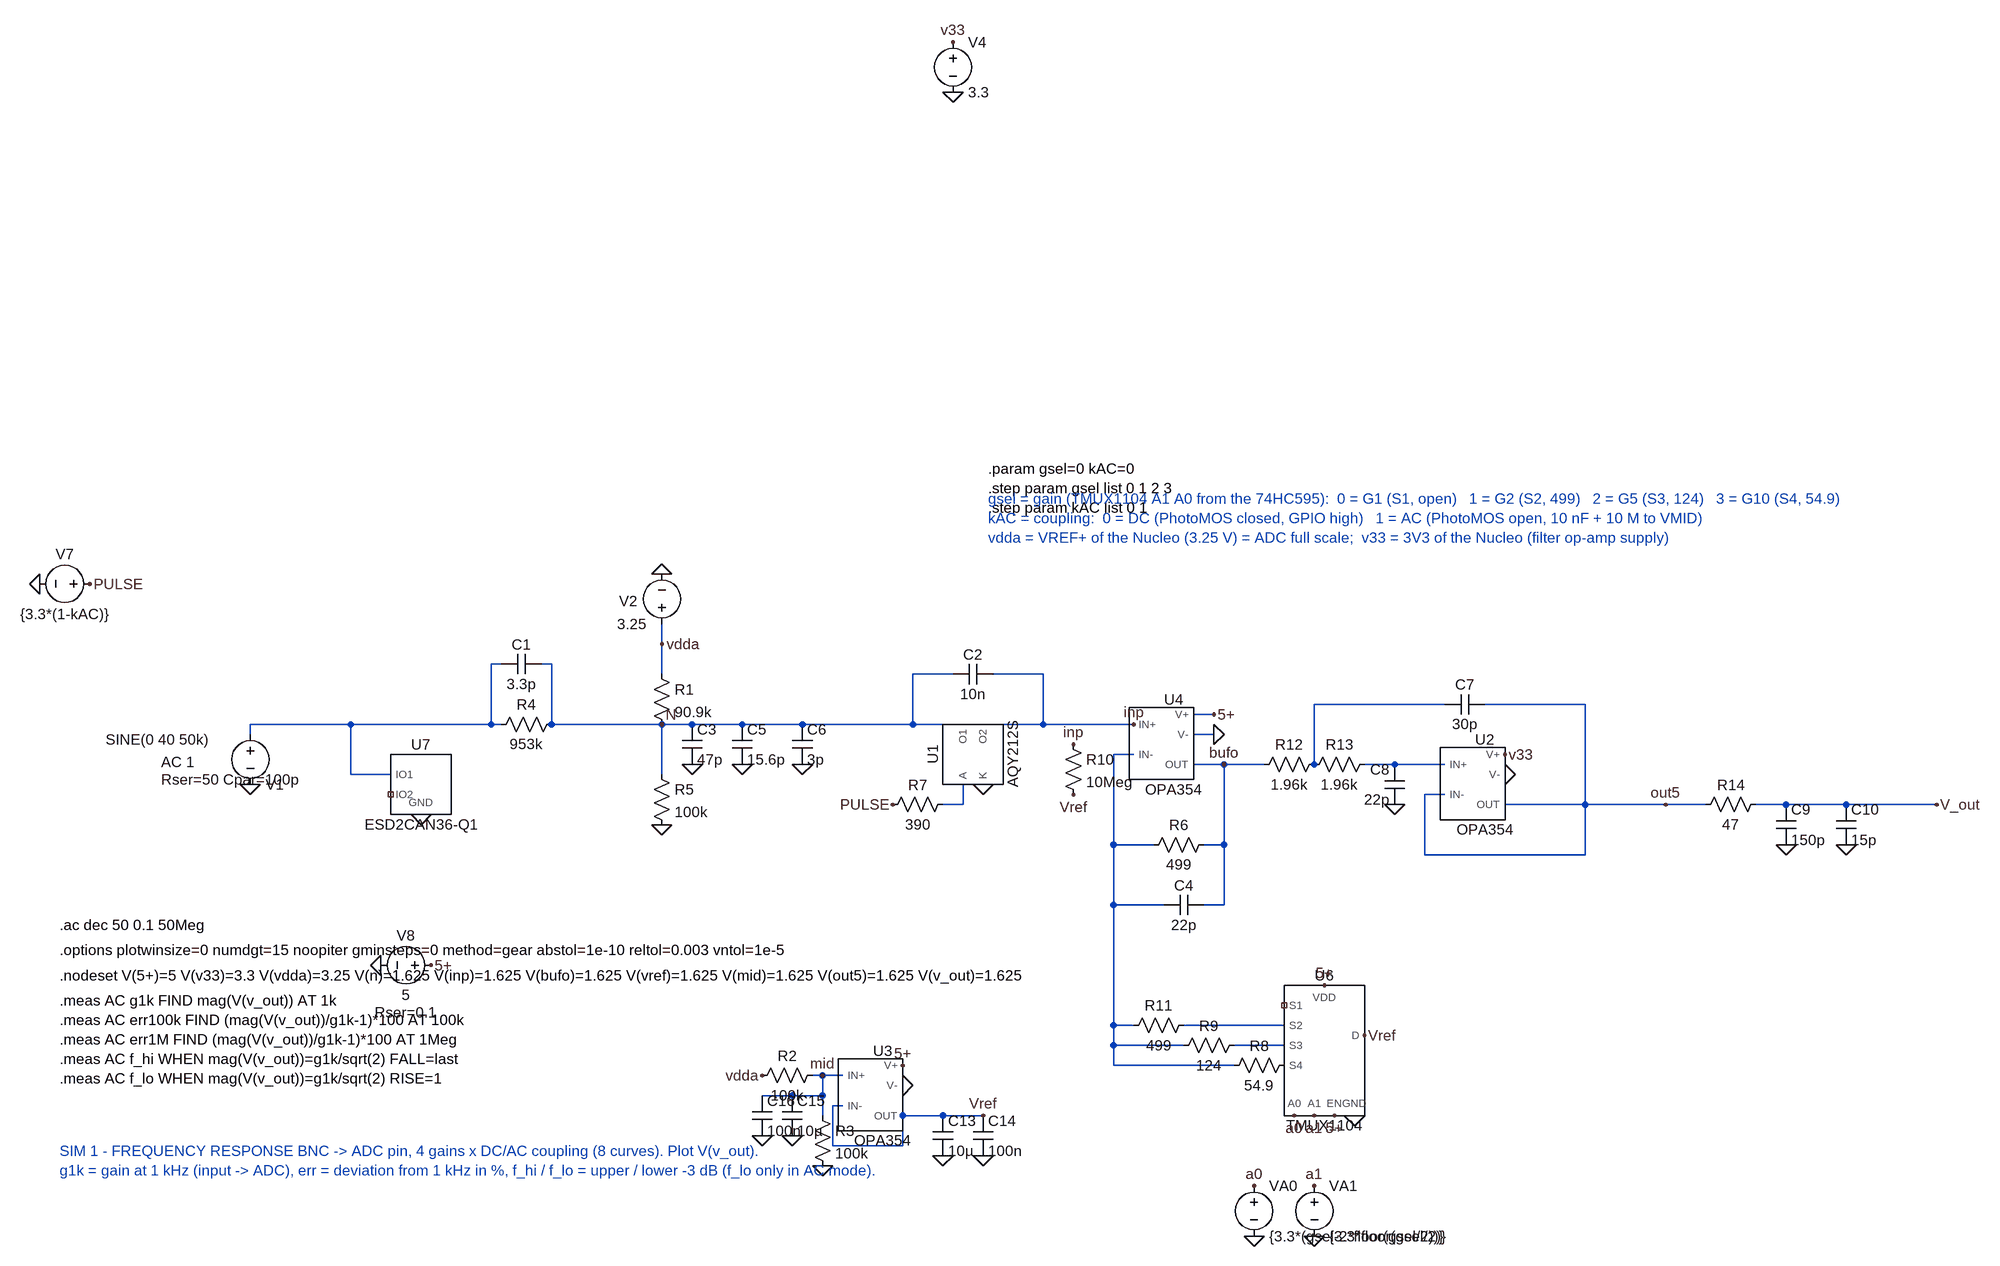
[diagram p0: schematic Analog Front End_v2_1_AC.asc]
Analog Front End_v2_1_AC.asc, the LTspice schematic file:
Version 4
SHEET 1 2772 884
WIRE 656 32 656 0
WIRE 400 64 384 64
WIRE 480 64 464 64
WIRE 656 80 656 32
WIRE 1120 80 1056 80
WIRE 1264 80 1184 80
WIRE 1904 128 1696 128
WIRE 2128 128 1968 128
WIRE 1536 144 1504 144
WIRE 160 160 0 160
WIRE 384 160 384 64
WIRE 384 160 160 160
WIRE 400 160 384 160
WIRE 480 160 480 64
WIRE 656 160 480 160
WIRE 704 160 656 160
WIRE 784 160 704 160
WIRE 880 160 784 160
WIRE 1056 160 1056 80
WIRE 1056 160 880 160
WIRE 1136 160 1056 160
WIRE 1264 160 1264 80
WIRE 1264 160 1168 160
WIRE 1408 160 1264 160
WIRE 0 176 0 160
WIRE 1536 176 1504 176
WIRE 1408 208 1376 208
WIRE 1552 224 1504 224
WIRE 1616 224 1552 224
WIRE 1696 224 1696 128
WIRE 1824 224 1776 224
WIRE 1904 224 1824 224
WIRE 160 240 160 160
WIRE 224 240 160 240
WIRE 656 240 656 160
WIRE 1904 272 1872 272
WIRE 1136 288 1136 256
WIRE 1136 288 1104 288
WIRE 2128 288 2128 128
WIRE 2128 288 2000 288
WIRE 2256 288 2128 288
WIRE 2320 288 2256 288
WIRE 2448 288 2400 288
WIRE 2544 288 2448 288
WIRE 2688 288 2544 288
WIRE 1376 352 1376 208
WIRE 1440 352 1376 352
WIRE 1552 352 1552 224
WIRE 1552 352 1520 352
WIRE 1872 368 1872 272
WIRE 2128 368 2128 288
WIRE 2128 368 1872 368
WIRE 1376 448 1376 352
WIRE 1456 448 1376 448
WIRE 1552 448 1552 352
WIRE 1552 448 1520 448
WIRE 1376 640 1376 448
WIRE 1408 640 1376 640
WIRE 1648 640 1488 640
WIRE 1376 672 1376 640
WIRE 1488 672 1376 672
WIRE 1648 672 1568 672
WIRE 1376 704 1376 672
WIRE 1568 704 1376 704
WIRE 912 720 896 720
WIRE 944 720 912 720
WIRE 864 752 816 752
WIRE 912 752 912 720
WIRE 912 752 864 752
WIRE 944 768 928 768
WIRE 912 784 912 752
WIRE 1104 784 1040 784
WIRE 1168 784 1104 784
WIRE 928 832 928 768
WIRE 1040 832 1040 784
WIRE 1040 832 928 832
FLAG 656 -80 0
FLAG 912 864 0
FLAG 656 320 0
FLAG 0 256 0
FLAG 1120 -928 v33
FLAG 1120 -848 0
FLAG 704 224 0
FLAG -256 -64 PULSE
FLAG -336 -64 0
FLAG 288 544 5+
FLAG 208 544 0
FLAG 784 224 0
FLAG 1536 144 5+
FLAG 1536 176 0
FLAG 880 224 0
FLAG 656 160 N
FLAG 1552 224 bufo
FLAG 912 720 mid
FLAG 656 32 vdda
FLAG 816 720 vdda
FLAG 1040 704 5+
FLAG 1040 736 0
FLAG 1168 784 Vref
FLAG 864 816 0
FLAG 816 816 0
FLAG 1104 848 0
FLAG 1168 848 0
FLAG 272 304 0
FLAG 1024 288 PULSE
FLAG 1168 256 0
FLAG 1776 656 Vref
FLAG 1760 784 0
FLAG 1824 288 0
FLAG 2000 208 v33
FLAG 2000 240 0
FLAG 2688 288 V_out
FLAG 2448 352 0
FLAG 2256 288 out5
FLAG 2544 352 0
FLAG 1712 576 5+
FLAG 1728 784 5+
FLAG 1664 784 a0
FLAG 1696 784 a1
FLAG 1600 896 a0
FLAG 1600 976 0
FLAG 1696 896 a1
FLAG 1696 976 0
FLAG 1408 160 inp
FLAG 1312 192 inp
FLAG 1312 272 Vref
SYMBOL voltage 656 16 R180
WINDOW 0 39 53 Left 2
WINDOW 3 24 16 Left 2
WINDOW 123 0 0 Left 0
WINDOW 39 0 0 Left 0
SYMATTR InstName V2
SYMATTR Value 3.25
SYMBOL res 640 64 R0
SYMATTR InstName R1
SYMATTR Value 90.9k
SYMBOL res 912 704 R90
WINDOW 0 0 56 VBottom 2
WINDOW 3 32 56 VTop 2
SYMATTR InstName R2
SYMATTR Value 100k
SYMBOL res 896 768 R0
SYMATTR InstName R3
SYMATTR Value 100k
SYMBOL res 640 224 R0
SYMATTR InstName R5
SYMATTR Value 100k
SYMBOL voltage 1120 -944 R0
WINDOW 123 0 0 Left 0
WINDOW 39 0 0 Left 0
SYMATTR InstName V4
SYMATTR Value 3.3
SYMBOL voltage 0 160 R0
WINDOW 0 24 96 Left 2
WINDOW 3 -231 24 Left 2
WINDOW 123 -142 60 Left 2
WINDOW 39 -142 88 Left 2
SYMATTR InstName V1
SYMATTR Value SINE(0 40 50k)
SYMATTR Value2 AC 1
SYMATTR SpiceLine Rser=50 Cpar=100p
SYMBOL cap 688 160 R0
SYMATTR InstName C3
SYMATTR Value 47p
SYMATTR SpiceLine Rser=0.3 Lser=0.7n
SYMBOL voltage -240 -64 R90
WINDOW 0 -32 56 VBottom 2
WINDOW 3 32 56 VTop 2
WINDOW 123 0 0 Left 0
WINDOW 39 0 0 Left 0
SYMATTR InstName V7
SYMATTR Value {3.3*(1-kAC)}
SYMBOL voltage 304 544 R90
WINDOW 0 -32 56 VBottom 2
WINDOW 3 32 56 VTop 2
WINDOW 123 0 0 Left 0
WINDOW 39 60 56 VTop 2
SYMATTR InstName V8
SYMATTR Value 5
SYMATTR SpiceLine Rser=0.1
SYMBOL OPA354 1472 192 R0
SYMATTR InstName U4
SYMBOL cap 768 160 R0
SYMATTR InstName C5
SYMATTR Value 15.6p
SYMATTR SpiceLine Rser=1 Lser=1n
SYMBOL cap 864 160 R0
SYMATTR InstName C6
SYMATTR Value 3p
SYMBOL OPA354 1008 752 R0
SYMATTR InstName U3
SYMBOL cap 848 752 R0
SYMATTR InstName C15
SYMATTR Value 10µ
SYMATTR SpiceLine Rser=0.02 Lser=1.5n
SYMBOL cap 800 752 R0
SYMATTR InstName C16
SYMATTR Value 100n
SYMATTR SpiceLine Rser=0.05 Lser=0.7n
SYMBOL cap 1088 784 R0
SYMATTR InstName C13
SYMATTR Value 10µ
SYMATTR SpiceLine Rser=1.02 Lser=1.5n
SYMBOL cap 1152 784 R0
SYMATTR InstName C14
SYMATTR Value 100n
SYMATTR SpiceLine Rser=0.05 Lser=0.7n
SYMBOL TMUX1104 1712 672 R0
SYMATTR InstName U6
SYMBOL ESD2CAN36-Q1 272 256 R0
SYMATTR InstName U7
SYMBOL res 496 144 R90
WINDOW 0 0 56 VBottom 2
WINDOW 3 32 56 VTop 2
SYMATTR InstName R4
SYMATTR Value 953k
SYMBOL cap 464 48 R90
WINDOW 0 0 32 VBottom 2
WINDOW 3 32 32 VTop 2
SYMATTR InstName C1
SYMATTR Value 3.3p
SYMATTR SpiceLine Rser=1 Lser=1n
SYMBOL cap 1184 64 R90
WINDOW 0 0 32 VBottom 2
WINDOW 3 32 32 VTop 2
SYMATTR InstName C2
SYMATTR Value 10n
SYMATTR SpiceLine Rser=1 Lser=1n
SYMBOL AQY212S 1152 208 R270
SYMATTR InstName U1
SYMBOL res 1120 272 R90
WINDOW 0 0 56 VBottom 2
WINDOW 3 32 56 VTop 2
SYMATTR InstName R7
SYMATTR Value 390
SYMBOL res 1536 336 R90
WINDOW 0 0 56 VBottom 2
WINDOW 3 32 56 VTop 2
SYMATTR InstName R6
SYMATTR Value 499
SYMBOL cap 1520 432 R90
WINDOW 0 0 32 VBottom 2
WINDOW 3 32 32 VTop 2
SYMATTR InstName C4
SYMATTR Value 22p
SYMATTR SpiceLine Rser=0.3 Lser=0.7n
SYMBOL res 1664 688 R90
WINDOW 0 0 56 VBottom 2
WINDOW 3 32 56 VTop 2
SYMATTR InstName R8
SYMATTR Value 54.9
SYMBOL res 1584 656 R90
WINDOW 0 0 56 VBottom 2
WINDOW 3 32 56 VTop 2
SYMATTR InstName R9
SYMATTR Value 124
SYMBOL res 1504 624 R90
WINDOW 0 0 56 VBottom 2
WINDOW 3 32 56 VTop 2
SYMATTR InstName R11
SYMATTR Value 499
SYMBOL OPA354 1968 256 R0
SYMATTR InstName U2
SYMBOL res 1712 208 R90
WINDOW 0 0 56 VBottom 2
WINDOW 3 32 56 VTop 2
SYMATTR InstName R12
SYMATTR Value 1.96k
SYMBOL res 1792 208 R90
WINDOW 0 0 56 VBottom 2
WINDOW 3 32 56 VTop 2
SYMATTR InstName R13
SYMATTR Value 1.96k
SYMBOL cap 1968 112 R90
WINDOW 0 0 32 VBottom 2
WINDOW 3 32 32 VTop 2
SYMATTR InstName C7
SYMATTR Value 30p
SYMATTR SpiceLine Rser=0.3 Lser=0.7n
SYMBOL cap 1840 288 R180
WINDOW 0 24 56 Left 2
WINDOW 3 24 8 Left 2
SYMATTR InstName C8
SYMATTR Value 22p
SYMATTR SpiceLine Rser=0.3 Lser=0.7n
SYMBOL res 2416 272 R90
WINDOW 0 0 56 VBottom 2
WINDOW 3 32 56 VTop 2
SYMATTR InstName R14
SYMATTR Value 47
SYMBOL cap 2432 288 R0
SYMATTR InstName C9
SYMATTR Value 150p
SYMATTR SpiceLine Rser=0.2 Lser=0.7n
SYMBOL cap 2528 288 R0
SYMATTR InstName C10
SYMATTR Value 15p
SYMBOL voltage 1600 880 R0
WINDOW 123 0 0 Left 0
WINDOW 39 0 0 Left 0
SYMATTR InstName VA0
SYMATTR Value {3.3*(gsel-2*floor(gsel/2))}
SYMBOL voltage 1696 880 R0
WINDOW 123 0 0 Left 0
WINDOW 39 0 0 Left 0
SYMATTR InstName VA1
SYMATTR Value {3.3*floor(gsel/2)}
SYMBOL res 1296 176 R0
SYMATTR InstName R10
SYMATTR Value 10Meg
TEXT -304 480 Left 2 !.ac dec 50 0.1 50Meg
TEXT 1176 -248 Left 2 !.param gsel=0 kAC=0\n.step param gsel list 0 1 2 3\n.step param kAC list 0 1
TEXT 1176 -200 Left 2 ;gsel = gain (TMUX1104 A1 A0 from the 74HC595):  0 = G1 (S1, open)   1 = G2 (S2, 499)   2 = G5 (S3, 124)   3 = G10 (S4, 54.9)\nkAC = coupling:  0 = DC (PhotoMOS closed, GPIO high)   1 = AC (PhotoMOS open, 10 nF + 10 M to VMID)\nvdda = VREF+ of the Nucleo (3.25 V) = ADC full scale;  v33 = 3V3 of the Nucleo (filter op-amp supply)
TEXT -304 520 Left 2 !.options plotwinsize=0 numdgt=15 noopiter gminsteps=0 method=gear abstol=1e-10 reltol=0.003 vntol=1e-5
TEXT -304 560 Left 2 !.nodeset V(5+)=5 V(v33)=3.3 V(vdda)=3.25 V(n)=1.625 V(inp)=1.625 V(bufo)=1.625 V(vref)=1.625 V(mid)=1.625 V(out5)=1.625 V(v_out)=1.625
TEXT -304 600 Left 2 !.meas AC g1k FIND mag(V(v_out)) AT 1k\n.meas AC err100k FIND (mag(V(v_out))/g1k-1)*100 AT 100k\n.meas AC err1M FIND (mag(V(v_out))/g1k-1)*100 AT 1Meg\n.meas AC f_hi WHEN mag(V(v_out))=g1k/sqrt(2) FALL=last\n.meas AC f_lo WHEN mag(V(v_out))=g1k/sqrt(2) RISE=1
TEXT -304 840 Left 2 ;SIM 1 - FREQUENCY RESPONSE BNC -> ADC pin, 4 gains x DC/AC coupling (8 curves). Plot V(v_out).\ng1k = gain at 1 kHz (input -> ADC), err = deviation from 1 kHz in %, f_hi / f_lo = upper / lower -3 dB (f_lo only in AC mode).

The netlist it stands for:
* Analog Front End_v2_1_AC.asc
V2 vdda 0 3.25
R1 vdda N 90.9k
R2 mid vdda 100k
R3 mid 0 100k
R5 N 0 100k
V4 v33 0 3.3
V1 N001 0 SINE(0 40 50k) AC 1 Rser=50 Cpar=100p
C3 N 0 47p Rser=0.3 Lser=0.7n
V7 PULSE 0 {3.3*(1-kAC)}
V8 5+ 0 5 Rser=0.1
XU4 inp N003 5+ 0 bufo OPA354  ; pins IN+ IN- V+ V- OUT
C5 N 0 15.6p Rser=1 Lser=1n
C6 N 0 3p
XU3 mid Vref 5+ 0 Vref OPA354  ; pins IN+ IN- V+ V- OUT
C15 mid 0 10µ Rser=0.02 Lser=1.5n
C16 mid 0 100n Rser=0.05 Lser=0.7n
C13 Vref 0 10µ Rser=1.02 Lser=1.5n
C14 Vref 0 100n Rser=0.05 Lser=0.7n
XU6 a0 NC_01 0 N007 5+ 5+ P001 Vref N006 a1 TMUX1104  ; pins A0 S1 GND S3 EN VDD S4 D S2 A1
XU7 N001 NC_02 0 ESD2CAN36-Q1  ; pins IO1 IO2 GND
R4 N N001 953k
C1 N N001 3.3p Rser=1 Lser=1n
C2 inp N 10n Rser=1 Lser=1n
XU1 N005 0 N inp AQY212S  ; pins A K O1 O2
R7 N005 PULSE 390
R6 bufo N003 499
C4 bufo N003 22p Rser=0.3 Lser=0.7n
R8 P001 N003 54.9
R9 N007 N003 124
R11 N006 N003 499
XU2 N004 out5 v33 0 out5 OPA354  ; pins IN+ IN- V+ V- OUT
R12 N002 bufo 1.96k
R13 N004 N002 1.96k
C7 out5 N002 30p Rser=0.3 Lser=0.7n
C8 0 N004 22p Rser=0.3 Lser=0.7n
R14 V_out out5 47
C9 V_out 0 150p Rser=0.2 Lser=0.7n
C10 V_out 0 15p
VA0 a0 0 {3.3*(gsel-2*floor(gsel/2))}
VA1 a1 0 {3.3*floor(gsel/2)}
R10 inp Vref 10Meg
.ac dec 50 0.1 50Meg
.param gsel=0 kAC=0
.step param gsel list 0 1 2 3
.step param kAC list 0 1
* gsel = gain (TMUX1104 A1 A0 from the 74HC595):  0 = G1 (S1, open)   1 = G2 (S2, 499)   2 = G5 (S3, 124)   3 = G10 (S4, 54.9)
* kAC = coupling:  0 = DC (PhotoMOS closed, GPIO high)   1 = AC (PhotoMOS open, 10 nF + 10 M to VMID)
* vdda = VREF+ of the Nucleo (3.25 V) = ADC full scale;  v33 = 3V3 of the Nucleo (filter op-amp supply)
.options plotwinsize=0 numdgt=15 noopiter gminsteps=0 method=gear abstol=1e-10 reltol=0.003 vntol=1e-5
.nodeset V(5+)=5 V(v33)=3.3 V(vdda)=3.25 V(n)=1.625 V(inp)=1.625 V(bufo)=1.625 V(vref)=1.625 V(mid)=1.625 V(out5)=1.625 V(v_out)=1.625
.meas AC g1k FIND mag(V(v_out)) AT 1k
.meas AC err100k FIND (mag(V(v_out))/g1k-1)*100 AT 100k
.meas AC err1M FIND (mag(V(v_out))/g1k-1)*100 AT 1Meg
.meas AC f_hi WHEN mag(V(v_out))=g1k/sqrt(2) FALL=last
.meas AC f_lo WHEN mag(V(v_out))=g1k/sqrt(2) RISE=1
* SIM 1 - FREQUENCY RESPONSE BNC -> ADC pin, 4 gains x DC/AC coupling (8 curves). Plot V(v_out).
* g1k = gain at 1 kHz (input -> ADC), err = deviation from 1 kHz in %, f_hi / f_lo = upper / lower -3 dB (f_lo only in AC mode).
.lib C:\Users\polus\OneDrive\Pulpit\Projekty\Oscyloskop\Symulacje\sboc018c\OPA354-PSpiceFiles\SCHEMATIC1\TransientSimulation\OPA354.lib
.lib C:\Users\polus\OneDrive\Pulpit\Projekty\Oscyloskop\Symulacje\TMUX1104.lib
.lib C:\Users\polus\OneDrive\Pulpit\Projekty\Oscyloskop\Symulacje\ESD2CAN36-Q1.lib
.lib C:\Users\polus\OneDrive\Pulpit\Projekty\Oscyloskop\Symulacje\AQY212S.lib
.backanno
.end